# Altium schematic sheet ADC.SchDoc: Sample Sheet Title
size B; Date: MM/DD/YYYY; Author: Sample Author; Organization: ORGANIZATION; Address1: ADDRESS 1; Address2: ADDRESS 2; Address3: ADDRESS 3; Address4: ADDRESS 4; Revision: -; SheetNumber: 1; SheetTotal: 4; ENG_APP_DATE: --/--/--; DSN_APP_DATE: --/--/--; CHK_APP_DATE: --/--/--
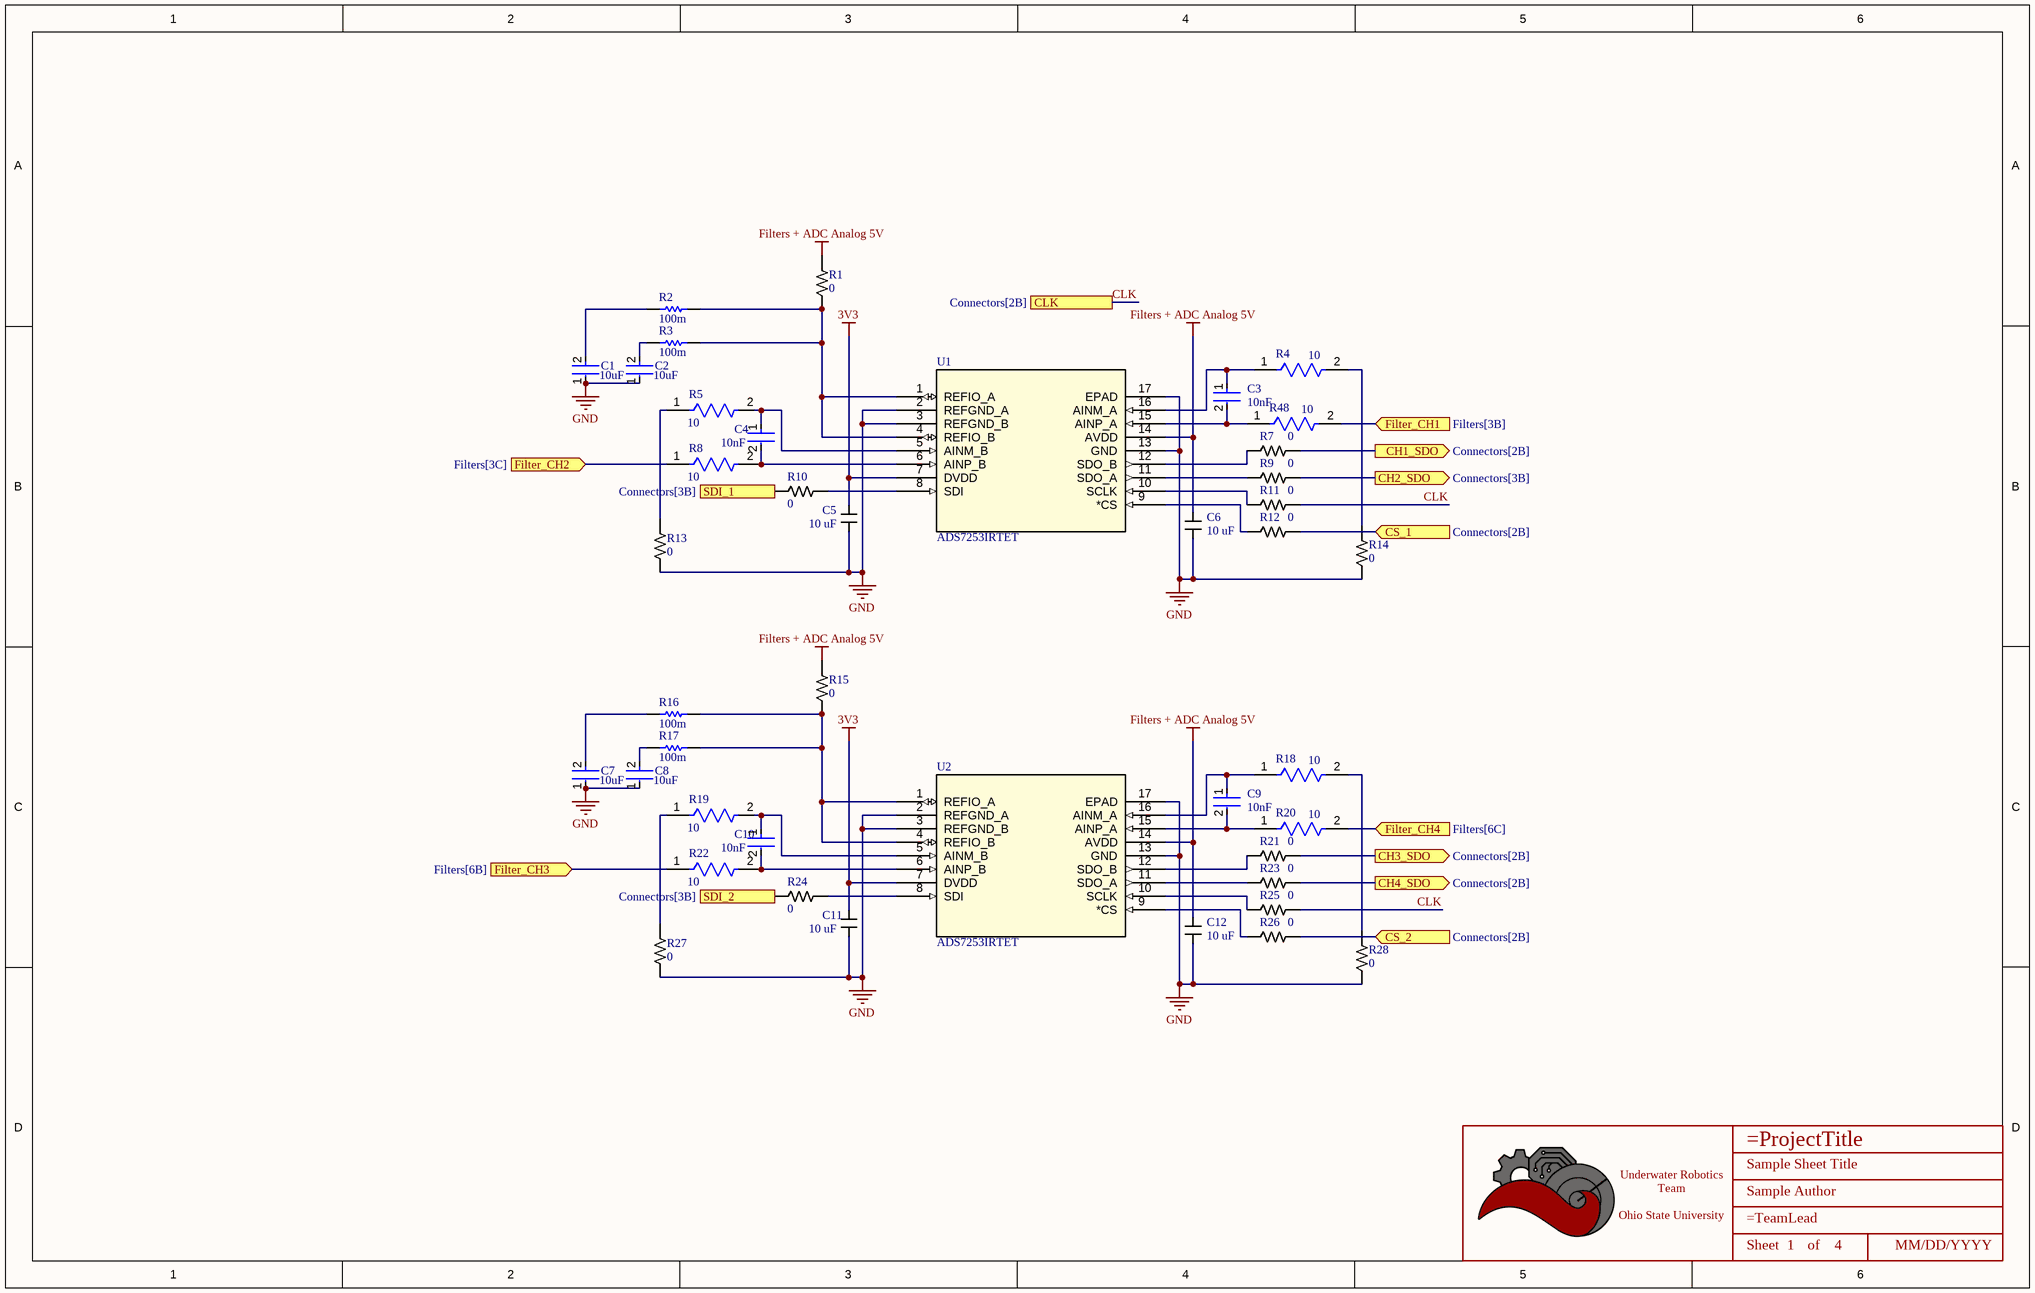
[diagram p0: ADC.SchDoc]

## Parts
*  Title_Block  [LOGO]  (value not drawn)  (graphical)
C1  value 10uF  [FP-CL21B106KOQNNNE-MFG]  (hidden comment: CL21B106KOQNNNE)
C2  value 10uF  [FP-CL21B106KOQNNNE-MFG]  (hidden comment: CL21B106KOQNNNE)
C3  Capacitance: 10nF  [FP-GRM219-0_1-IPC_B]  (hidden comment: GRM2195C1H103JA01D)
C4  Capacitance: 10nF  [FP-GRM219-0_1-IPC_B]  (hidden comment: GRM2195C1H103JA01D)
C5  Value (uF): 10 uF  [CAPACITOR_0603]  (hidden comment: 10uF Ceramic 6.3V)
C6  Value (uF): 10 uF  [CAPACITOR_0603]  (hidden comment: 10uF Ceramic 6.3V)
C7  value 10uF  [FP-CL21B106KOQNNNE-MFG]  (hidden comment: CL21B106KOQNNNE)
C8  value 10uF  [FP-CL21B106KOQNNNE-MFG]  (hidden comment: CL21B106KOQNNNE)
C9  Capacitance: 10nF  [FP-GRM219-0_1-IPC_B]  (hidden comment: GRM2195C1H103JA01D)
C10  Capacitance: 10nF  [FP-GRM219-0_1-IPC_B]  (hidden comment: GRM2195C1H103JA01D)
C11  Value (uF): 10 uF  [CAPACITOR_0603]  (hidden comment: 10uF Ceramic 6.3V)
C12  Value (uF): 10 uF  [CAPACITOR_0603]  (hidden comment: 10uF Ceramic 6.3V)
R1  Value  (Ohms): 0  [RESISTOR_0402]  (hidden comment: 0 Ohm 1% 1/16W)
R2  100m  [RESC1005X40X25NL10T10]
R3  100m  [RESC1005X40X25NL10T10]
R4  Resistance: 10  [FP-RMCF0603-MFG]  (hidden comment: RMCF0603FT10R0)
R5  Resistance: 10  [FP-RMCF0603-MFG]  (hidden comment: RMCF0603FT10R0)
R7  Value  (Ohms): 0  [RESISTOR_0402]  (hidden comment: 0 Ohm 1% 1/16W)
R8  Resistance: 10  [FP-RMCF0603-MFG]  (hidden comment: RMCF0603FT10R0)
R9  Value  (Ohms): 0  [RESISTOR_0402]  (hidden comment: 0 Ohm 1% 1/16W)
R10  Value  (Ohms): 0  [RESISTOR_0402]  (hidden comment: 0 Ohm 1% 1/16W)
R11  Value  (Ohms): 0  [RESISTOR_0402]  (hidden comment: 0 Ohm 1% 1/16W)
R12  Value  (Ohms): 0  [RESISTOR_0402]  (hidden comment: 0 Ohm 1% 1/16W)
R13  Value  (Ohms): 0  [RESISTOR_0402]  (hidden comment: 0 Ohm 1% 1/16W)
R14  Value  (Ohms): 0  [RESISTOR_0402]  (hidden comment: 0 Ohm 1% 1/16W)
R15  Value  (Ohms): 0  [RESISTOR_0402]  (hidden comment: 0 Ohm 1% 1/16W)
R16  100m  [RESC1005X40X25NL10T10]
R17  100m  [RESC1005X40X25NL10T10]
R18  Resistance: 10  [FP-RMCF0603-MFG]  (hidden comment: RMCF0603FT10R0)
R19  Resistance: 10  [FP-RMCF0603-MFG]  (hidden comment: RMCF0603FT10R0)
R20  Resistance: 10  [FP-RMCF0603-MFG]  (hidden comment: RMCF0603FT10R0)
R21  Value  (Ohms): 0  [RESISTOR_0402]  (hidden comment: 0 Ohm 1% 1/16W)
R22  Resistance: 10  [FP-RMCF0603-MFG]  (hidden comment: RMCF0603FT10R0)
R23  Value  (Ohms): 0  [RESISTOR_0402]  (hidden comment: 0 Ohm 1% 1/16W)
R24  Value  (Ohms): 0  [RESISTOR_0402]  (hidden comment: 0 Ohm 1% 1/16W)
R25  Value  (Ohms): 0  [RESISTOR_0402]  (hidden comment: 0 Ohm 1% 1/16W)
R26  Value  (Ohms): 0  [RESISTOR_0402]  (hidden comment: 0 Ohm 1% 1/16W)
R27  Value  (Ohms): 0  [RESISTOR_0402]  (hidden comment: 0 Ohm 1% 1/16W)
R28  Value  (Ohms): 0  [RESISTOR_0402]  (hidden comment: 0 Ohm 1% 1/16W)
R48  Resistance: 10  [FP-RMCF0603-MFG]  (hidden comment: RMCF0603FT10R0)
U1  ADS7253IRTET  [WQFN-16]
U2  ADS7253IRTET  [WQFN-16]

## Ports
CH1_SDO (out, see Connectors[2B]), CH2_SDO (out, see Connectors[3B]), CH3_SDO (out, see Connectors[2B]), CH4_SDO (out, see Connectors[2B]), CLK (see Connectors[2B]), CS_1 (in, see Connectors[2B]), CS_2 (in, see Connectors[2B]), Filter_CH1 (in, see Filters[3B]), Filter_CH2 (in, see Filters[3C]), Filter_CH3 (in, see Filters[6B]), Filter_CH4 (in, see Filters[6C]), SDI_1 (in, see Connectors[3B]), SDI_2 (in, see Connectors[3B])

## Nets
3V3: C5.2 C11.2 U1.7(DVDD) U2.7(DVDD)
Filters + ADC Analog 5V: C6.2 C12.2 R1.1 R15.1 U1.14(AVDD) U2.14(AVDD)
GND: C1.1 C2.1 C5.1 C6.1 C7.1 C8.1 C11.1 C12.1 R13.2 R14.2 R27.2 R28.2 U1.2(REFGND_A) U1.3(REFGND_B) U1.13(GND) U1.17(EPAD) U2.2(REFGND_A) U2.3(REFGND_B) U2.13(GND) U2.17(EPAD)
CH1_SDO: R7.1 ; port CH1_SDO
CH2_SDO: R9.1 ; port CH2_SDO
CH3_SDO: R21.1 ; port CH3_SDO
CH4_SDO: R23.1 ; port CH4_SDO
CLK: R11.1 R25.1 ; port CLK
CS_1: R12.1 ; port CS_1
CS_2: R26.1 ; port CS_2
Filter_CH1: R48.2 ; port Filter_CH1
Filter_CH2: R8.1 ; port Filter_CH2
Filter_CH3: R22.1 ; port Filter_CH3
Filter_CH4: R20.2 ; port Filter_CH4
SDI_1: R10.2 ; port SDI_1
SDI_2: R24.2 ; port SDI_2
NetC1_2: C1.2 R2.2
NetC2_2: C2.2 R3.2
NetC3_1: C3.1 R4.1 U1.16(AINM_A)
NetC3_2: C3.2 R48.1 U1.15(AINP_A)
NetC4_1: C4.1 R5.2 U1.5(AINM_B)
NetC4_2: C4.2 R8.2 U1.6(AINP_B)
NetC7_2: C7.2 R16.2
NetC8_2: C8.2 R17.2
NetC9_1: C9.1 R18.1 U2.16(AINM_A)
NetC9_2: C9.2 R20.1 U2.15(AINP_A)
NetC10_1: C10.1 R19.2 U2.5(AINM_B)
NetC10_2: C10.2 R22.2 U2.6(AINP_B)
NetR1_2: R1.2 R2.1 R3.1 U1.1(REFIO_A) U1.4(REFIO_B)
NetR4_2: R4.2 R14.1
NetR5_1: R5.1 R13.1
NetR7_2: R7.2 U1.12(SDO_B)
NetR9_2: R9.2 U1.11(SDO_A)
NetR10_1: R10.1 U1.8(SDI)
NetR11_2: R11.2 U1.10(SCLK)
NetR12_2: R12.2 U1.9(*CS)
NetR15_2: R15.2 R16.1 R17.1 U2.1(REFIO_A) U2.4(REFIO_B)
NetR18_2: R18.2 R28.1
NetR19_1: R19.1 R27.1
NetR21_2: R21.2 U2.12(SDO_B)
NetR23_2: R23.2 U2.11(SDO_A)
NetR24_1: R24.1 U2.8(SDI)
NetR25_2: R25.2 U2.10(SCLK)
NetR26_2: R26.2 U2.9(*CS)

## Notes on the sheet
- DWG. NO.
- REV.
- SHT.
- THIS DOCUMENT AND THE DATA DISCLOSED HEREIN OR HEREWITH IS THE PROPERTY OF ALTIUM LIMITED AND MAY BE FREELY DISTRIBUTED IN WHOLE. NO RIGHTS ARE RESERVED OR EXPRESS OR IMPLIED WARANTEE GIVEN.
- REVISION
- DESCRIPTION
- DATE
- APPROVED
- ENG:
- APPROVALS
- PROJECT
- DSN:
- CHK:
- REFERENCE DOCUMENTS
- PROJECT REVISION:
- TITLE
- DOCUMENT REVISION:
- DESIGN ITEM:
- BOM:
- FAB DWG:
- PCB DWG:
- ASSY DWG:
- SCALE:
- SIZE
- B
- CAGE CODE
- FILE NAME
- DWG NO.
- SHEET
- OF
- REV
- (in symbol Title_Block) Underwater Robotics Team / Ohio State University; Sheet; of

## Library data of the parts
* = Title_Block: UWRT Schematic Title Block Template / Created June 2021, Dylan Trainor
C1 C2 C7 C8 = CMP-2000-06106-2: CAP CER 10UF 16V X7R 0805; Manufacturer: Samsung Electro-Mechanics America, Inc; Material: Ceramic; Tolerance: 10%; Temperature Coefficient: 15%; Digikey Description: CAP CER 10UF 16V X7R 0805; Lead Free: Yes; ComponentLink2URL: http://www.samsungsem.com/servlet/FileDownload?path=productsearch&sname=CL21B106KOQNNNE.pdf&oname=CL21B106KOQNNNE.pdf; ComponentLink2Description: Datasheet; Temperature Range Low: -55°C; RoHS: TRUE; Category: Cap; Temperature Characteristic: X7R; Manufacturer Part Number: CL21B106KOQNNNE; Automotive: No; Octopart: https://octopart.com/cl21b106koqnnne-samsung-19832289; Device Class L3: Ceramic Capacitors; Temperature Range High: +125°C; Height: 1.4mm; Device Class L2: Capacitors; Voltage Rating: 16V; Temperature: -55°C to +125°C; Device Class L1: Passive Components; Ipc Land Pattern Name: CAPC200125X125; Package: CL21B106KOQNNNE; Capacitance: 10uF
C3 C4 C9 C10 = CMP-2007-00135-2: Chip Multilayer Ceramic Capacitors for General Purpose, 0805, 10000pF, C0G, 30ppm/°C, 5%, 50V; Insulation Resistance: 10GR; Max Operating Temperature: 125°C; Height: 0.85mm; Voltage: 50V; Dielectric Material: Ceramic; Voltage Rating: 50V; Dielectric: C0G; Thickness: 0.037inch; REACH SVHC: No SVHC; Lead Free: Lead Free; Depth: 1.25mm; Min Operating Temperature: -55°C; Package Quantity: 1; Packaging: Tape and Reel; Case Code (Imperial): 0805; Case/Package: 0805; Mount: Surface Mount; Width: 0.049inch; Case Code (Metric): 2012; Length: 2mm; Termination: SMD/SMT; Material: Ceramic; Tolerance: 5%; Temperature Coefficient: 30ppm/°C; Number of Pins: 2; Voltage Rating (DC): 50V; Radiation Hardening: No
C5 C6 C11 C12 = CAPACITOR_10uF_0603: Cap 10uF 6.3V +/-20% / Ceramic 0603; Made By: Flip B; ComponentLink1Description: Digikey; ComponentLink1URL: https://www.digikey.com/en/products/detail/samsung-electro-mechanics/CL10A106MQ8NNNC/3886777; Supplier 1: Digi-Key; Supplier Part Number 1: 1276-1119-1-ND; Tolerance: +/- 20%; Voltage: 6.3V
R1 R7 R9-R15 R21 R23-R28 = RESISTOR_0_0402: RES 0 OHM 1% 1/16W 0402; Tolerance: +/- 1%; Made By: Robert Pafford; Wattage: 1/16W; Supplier 1: Digikey; Supplier Part Number 1: 13-AC0402FR-070RLCT-ND
R2 R3 R16 R17 = CMP-2002-06400-1: Manufacturer: Yageo; Part Number: RL0402JR-070R1L
R4 R5 R8 R18-R20 R22 R48 = CMP-26527-005040-1: 10Ω ±1% 0.1W 0603 Thick Film Chip Resistor AEC-Q200 compliant; Max Power Dissipation: 100mW; Temperature Coefficient: 100ppm/°C; Radiation Hardening: No; Military Standard: Not; Resistor Type: Thick Film; Case/Package: 0603; Case Code (Metric): 1608; Power Rating: 100mW; Min Operating Temperature: -55°C; Mount: Surface Mount; Width: 0.031inch; Packaging: Tape and Reel; Tolerance: 1%; Case Code (Imperial): 0603; Number of Terminations: 2; Height: 0.022inch; Features: Automotive AEC-Q200; Construction: Rectangular; Contact Plating: Tin; RoHS Compliant: Yes; Length: 1.55mm; Max Operating Temperature: 155°C; Depth: 0.8mm; Series: RMCF
U1 U2 = ADS7253IRTET: 12 Bit, 1 MSPS, Dual, Simultaneous Sampling Single Ended / Pseudo-Differential SAR ADC 16-WQFN -40 to 125; Manufacturer: TI; Max Sampling: 1 MSpS; Supplier 1: DigiKey; Supplier Part Number 1: 296-38482-1-ND; Created By: John Ulm